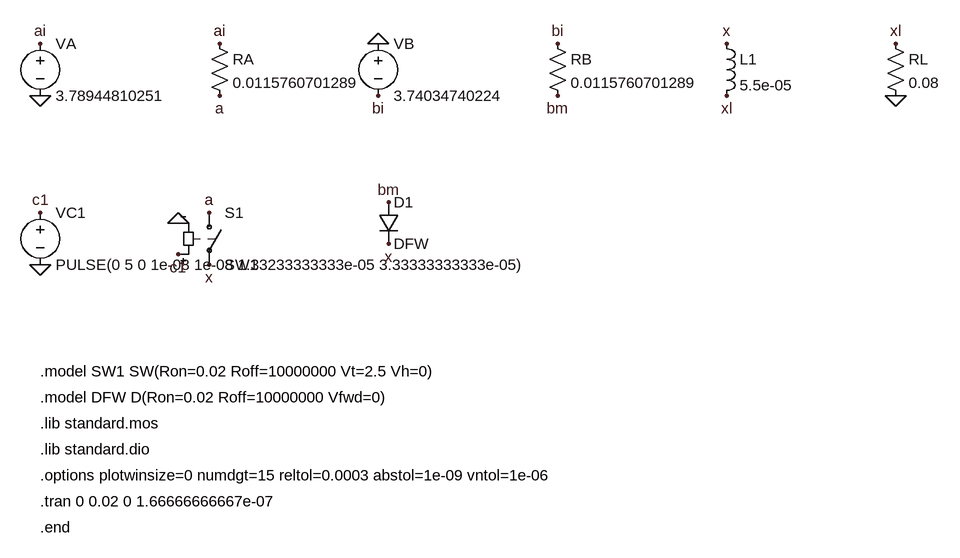
[diagram p0: schematic buck_boost_diode_ideal.asc]
buck_boost_diode_ideal.asc, the LTspice schematic file:
Version 4
SHEET 1 1880 1200
SYMBOL voltage 160 120 R0
SYMATTR InstName VA
SYMATTR Value 3.78944810251
FLAG 160 136 ai
FLAG 160 216 0
SYMBOL res 420 120 R0
SYMATTR InstName RA
SYMATTR Value 0.0115760701289
FLAG 436 136 ai
FLAG 436 216 a
SYMBOL voltage 680 120 R0
SYMATTR InstName VB
SYMATTR Value 3.74034740224
FLAG 680 136 0
FLAG 680 216 bi
SYMBOL res 940 120 R0
SYMATTR InstName RB
SYMATTR Value 0.0115760701289
FLAG 956 136 bi
FLAG 956 216 bm
SYMBOL ind 1200 120 R0
SYMATTR InstName L1
SYMATTR Value 5.5e-05
FLAG 1216 136 x
FLAG 1216 216 xl
SYMBOL res 1460 120 R0
SYMATTR InstName RL
SYMATTR Value 0.08
FLAG 1476 136 xl
FLAG 1476 216 0
SYMBOL voltage 160 380 R0
SYMATTR InstName VC1
SYMATTR Value PULSE(0 5 0 1e-08 1e-08 1.33233333333e-05 3.33333333333e-05)
FLAG 160 396 c1
FLAG 160 476 0
SYMBOL sw 420 380 R0
SYMATTR InstName S1
SYMATTR Value SW1
FLAG 420 396 a
FLAG 420 476 x
FLAG 372 460 c1
FLAG 372 412 0
SYMBOL diode 680 380 R0
SYMATTR InstName D1
SYMATTR Value DFW
FLAG 696 380 bm
FLAG 696 444 x
TEXT 160 640 Left 2 !.model SW1 SW(Ron=0.02 Roff=10000000 Vt=2.5 Vh=0)
TEXT 160 680 Left 2 !.model DFW D(Ron=0.02 Roff=10000000 Vfwd=0)
TEXT 160 720 Left 2 !.lib standard.mos
TEXT 160 760 Left 2 !.lib standard.dio
TEXT 160 800 Left 2 !.options plotwinsize=0 numdgt=15 reltol=0.0003 abstol=1e-09 vntol=1e-06
TEXT 160 840 Left 2 !.tran 0 0.02 0 1.66666666667e-07
TEXT 160 880 Left 2 !.end

The netlist it stands for:
* buck_boost_diode_ideal.asc
VA ai 0 3.78944810251
RA ai a 0.0115760701289
VB 0 bi 3.74034740224
RB bi bm 0.0115760701289
L1 x xl 5.5e-05
RL xl 0 0.08
VC1 c1 0 PULSE(0 5 0 1e-08 1e-08 1.33233333333e-05 3.33333333333e-05)
S1 a x c1 0 SW1
D1 bm x DFW
.model D D
.lib standard.dio
.model SW1 SW(Ron=0.02 Roff=10000000 Vt=2.5 Vh=0)
.model DFW D(Ron=0.02 Roff=10000000 Vfwd=0)
.lib standard.mos
.lib standard.dio
.options plotwinsize=0 numdgt=15 reltol=0.0003 abstol=1e-09 vntol=1e-06
.tran 0 0.02 0 1.66666666667e-07
.end
.backanno
.end